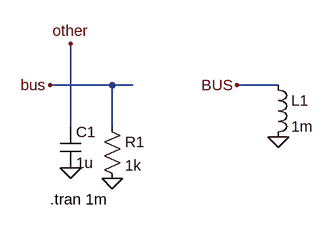
[diagram p0: schematic ltspice-layout.asc]
ltspice-layout.asc, the LTspice schematic file:
Version 4.1
SHEET 1 400 240
WIRE 96 0 -32 0
WIRE 0 64 0 -64
WIRE 64 64 64 0
WIRE 320 0 256 0
FLAG -32 0 bus
FLAG 0 -64 other
FLAG 256 0 BUS
FLAG 0 128 0
FLAG 64 144 0
FLAG 320 80 0
SYMBOL cap -16 64 R0
SYMATTR InstName C1
SYMATTR Value 1u
SYMBOL res 48 48 R0
SYMATTR InstName R1
SYMATTR Value 1k
SYMBOL ind 304 -16 R0
SYMATTR InstName L1
SYMATTR Value 1m
TEXT -32 176 Left 2 !.tran 1m

The netlist it stands for:
* ltspice-layout.asc
C1 other 0 1u
R1 bus 0 1k
L1 bus 0 1m
.tran 1m
.backanno
.end